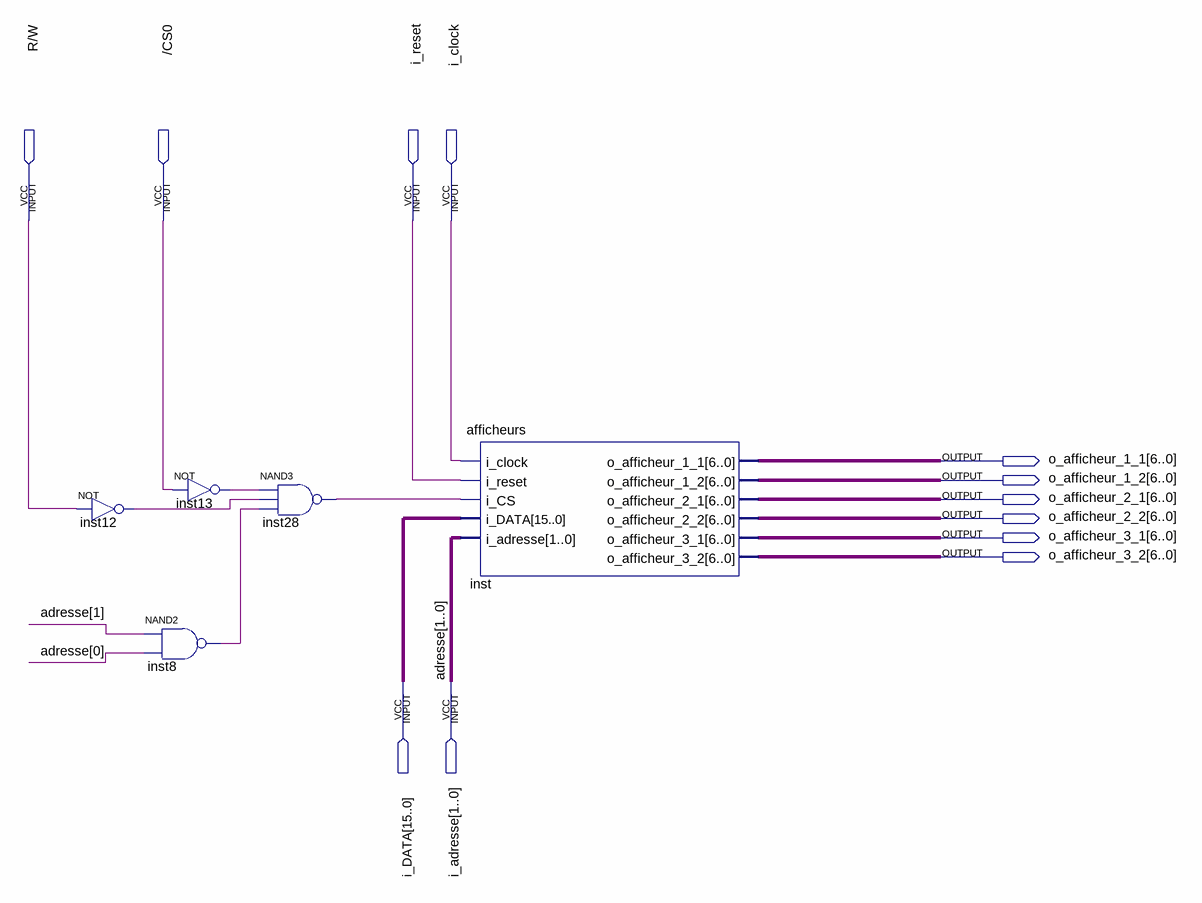
[diagram p0: schematic sheet]
// Quartus schematic AFFICHEUR_ROBOT.bdf as structural Verilog: 5 symbols, 12 pins
module AFFICHEUR_ROBOT (
  input  \R/W ,
  input  \/CS0 ,
  input  i_reset,
  input  i_clock,
  input  [15:0] i_DATA,
  input  [1:0] i_adresse,
  output [6:0] o_afficheur_1_1,
  output [6:0] o_afficheur_1_2,
  output [6:0] o_afficheur_2_1,
  output [6:0] o_afficheur_2_2,
  output [6:0] o_afficheur_3_1,
  output [6:0] o_afficheur_3_2
);

  wire inst8_out, inst12_out, inst13_out, inst28_out;

  not inst12 (inst12_out, \R/W );
  not inst13 (inst13_out, \/CS0 );
  nand inst8 (inst8_out, i_adresse[1], i_adresse[0]);
  nand inst28 (inst28_out, inst13_out, inst12_out, inst8_out);
  afficheurs inst (
    .i_clock(i_clock), .i_reset(i_reset), .i_CS(inst28_out), .i_DATA(i_DATA), .i_adresse(i_adresse),
    .o_afficheur_1_1(o_afficheur_1_1), .o_afficheur_1_2(o_afficheur_1_2), .o_afficheur_2_1(o_afficheur_2_1),
    .o_afficheur_2_2(o_afficheur_2_2), .o_afficheur_3_1(o_afficheur_3_1), .o_afficheur_3_2(o_afficheur_3_2));

  // Other names for the same wires on the sheet: adresse[1:0] = i_adresse
endmodule
